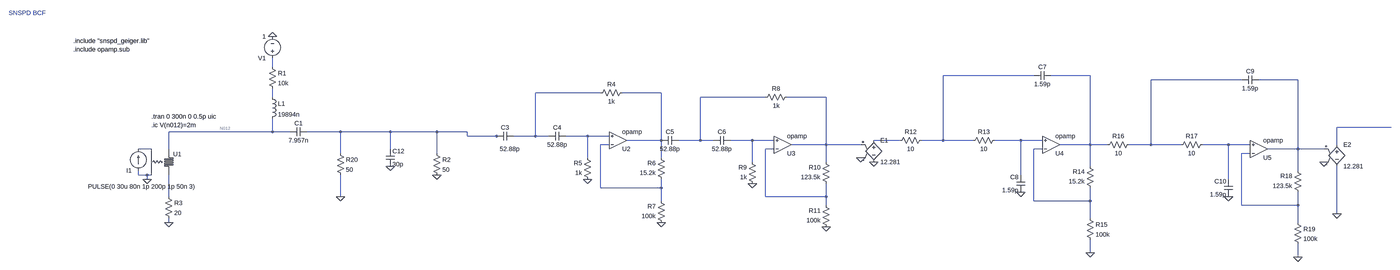
[diagram p0: schematic snspd-bcf.asc, whole sheet]
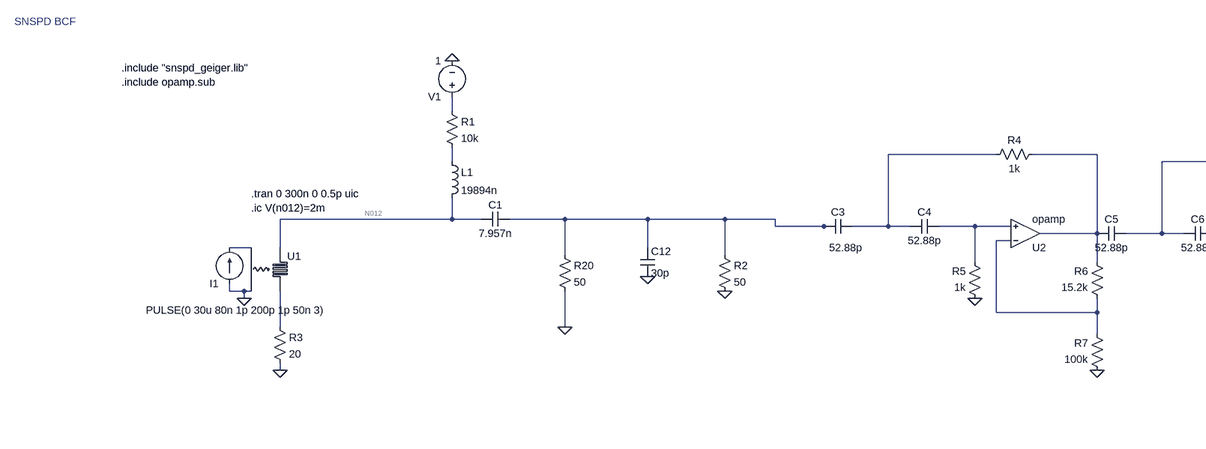
[diagram p1: schematic snspd-bcf.asc, part, row 1 of 1, column 1 of 2]
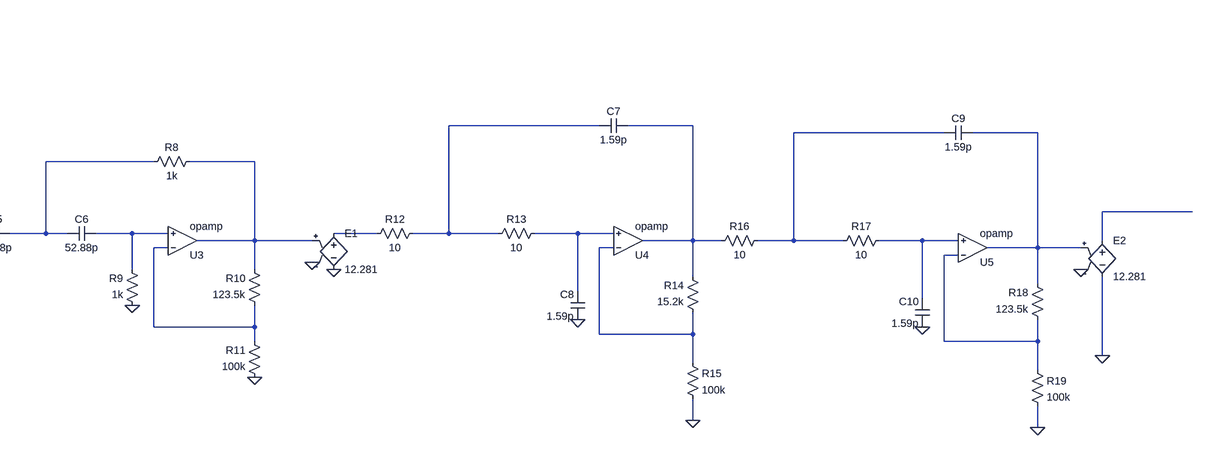
[diagram p2: schematic snspd-bcf.asc, part, row 1 of 1, column 2 of 2]
snspd-bcf.asc, the LTspice schematic file:
Version 4
SHEET 1 5868 720
WIRE 640 -768 640 -800
WIRE 3712 -736 3376 -736
WIRE 3920 -736 3776 -736
WIRE 4480 -720 4144 -720
WIRE 4688 -720 4544 -720
WIRE 2112 -672 1872 -672
WIRE 2336 -672 2192 -672
WIRE 640 -656 640 -688
WIRE 2720 -656 2480 -656
WIRE 2944 -656 2800 -656
WIRE 5056 -544 4832 -544
WIRE 640 -528 640 -576
WIRE 640 -528 224 -528
WIRE 704 -528 640 -528
WIRE 976 -528 768 -528
WIRE 1168 -528 976 -528
WIRE 1488 -528 1168 -528
WIRE 1600 -528 1488 -528
WIRE 1600 -512 1600 -528
WIRE 1728 -512 1600 -512
WIRE 1744 -512 1728 -512
WIRE 1872 -512 1872 -672
WIRE 1872 -512 1792 -512
WIRE 1920 -512 1872 -512
WIRE 2064 -512 1984 -512
WIRE 2144 -512 2064 -512
WIRE 2336 -496 2336 -672
WIRE 2336 -496 2208 -496
WIRE 2480 -496 2480 -656
WIRE 2480 -496 2400 -496
WIRE 2528 -496 2480 -496
WIRE 2672 -496 2592 -496
WIRE 2752 -496 2672 -496
WIRE 3216 -496 3120 -496
WIRE 3376 -496 3376 -736
WIRE 3376 -496 3296 -496
WIRE 3488 -496 3376 -496
WIRE 3664 -496 3568 -496
WIRE 3744 -496 3664 -496
WIRE 2144 -480 2112 -480
WIRE 2944 -480 2944 -656
WIRE 2944 -480 2816 -480
WIRE 3072 -480 2944 -480
WIRE 3920 -480 3920 -736
WIRE 3920 -480 3808 -480
WIRE 3984 -480 3920 -480
WIRE 4144 -480 4144 -720
WIRE 4144 -480 4064 -480
WIRE 4256 -480 4144 -480
WIRE 4432 -480 4336 -480
WIRE 4512 -480 4432 -480
WIRE 4832 -480 4832 -544
WIRE 160 -464 112 -464
WIRE 224 -464 224 -528
WIRE 1168 -464 1168 -528
WIRE 2752 -464 2720 -464
WIRE 3744 -464 3712 -464
WIRE 4688 -464 4688 -720
WIRE 4688 -464 4576 -464
WIRE 4784 -464 4688 -464
WIRE 976 -448 976 -528
WIRE 1488 -448 1488 -528
WIRE 4512 -448 4480 -448
WIRE 2064 -432 2064 -512
WIRE 2336 -432 2336 -496
WIRE 2672 -416 2672 -496
WIRE 2944 -416 2944 -480
WIRE 3920 -400 3920 -480
WIRE 4688 -384 4688 -464
WIRE 112 -368 112 -384
WIRE 144 -368 112 -368
WIRE 160 -368 144 -368
WIRE 3664 -368 3664 -496
WIRE 144 -352 144 -368
WIRE 4432 -352 4432 -480
WIRE 2112 -320 2112 -480
WIRE 2336 -320 2336 -352
WIRE 2336 -320 2112 -320
WIRE 224 -288 224 -368
WIRE 976 -288 976 -368
WIRE 2720 -288 2720 -464
WIRE 2944 -288 2944 -336
WIRE 2944 -288 2720 -288
WIRE 2336 -272 2336 -320
WIRE 3712 -272 3712 -464
WIRE 3920 -272 3920 -320
WIRE 3920 -272 3712 -272
WIRE 2944 -256 2944 -288
WIRE 4480 -256 4480 -448
WIRE 4688 -256 4688 -304
WIRE 4688 -256 4480 -256
WIRE 4832 -224 4832 -400
WIRE 3920 -208 3920 -272
WIRE 224 -192 224 -208
WIRE 4688 -192 4688 -256
WIRE 3920 -80 3920 -128
WIRE 4688 -64 4688 -112
FLAG 144 -352 0
FLAG 640 -880 0
FLAG 2336 -192 0
FLAG 2064 -352 0
FLAG 2944 -176 0
FLAG 2672 -336 0
FLAG 3664 -304 0
FLAG 3072 -432 0
FLAG 3120 -416 0
FLAG 3920 -80 0
FLAG 4432 -288 0
FLAG 4688 -64 0
FLAG 4832 -224 0
FLAG 4784 -416 0
FLAG 224 -192 0
FLAG 976 -288 0
FLAG 1488 -368 0
FLAG 1168 -400 0
SYMBOL snspdWithPhotonPort 224 -416 R0
WINDOW 39 -7 -9 Center 2
SYMATTR SpiceLine ""
SYMATTR InstName U1
SYMBOL current 112 -384 R180
WINDOW 3 -212 -59 Left 2
WINDOW 123 0 0 Left 2
WINDOW 39 0 0 Left 2
SYMATTR Value PULSE(0 30u 80n 1p 200p 1p 50n 3)
SYMATTR InstName I1
SYMBOL voltage 640 -784 R180
WINDOW 123 0 0 Left 2
WINDOW 39 24 -6 Left 2
SYMATTR InstName V1
SYMATTR Value 1
SYMBOL Cap 1792 -528 R90
WINDOW 0 0 32 VBottom 2
WINDOW 3 48 15 VTop 2
SYMATTR InstName C3
SYMATTR Value 52.88p
SYMBOL Cap 1984 -528 R90
WINDOW 0 0 32 VBottom 2
WINDOW 3 32 32 VTop 2
SYMATTR InstName C4
SYMATTR Value 52.88p
SYMBOL Res 2208 -688 R90
WINDOW 0 0 56 VBottom 2
WINDOW 3 32 56 VTop 2
SYMATTR InstName R4
SYMATTR Value 1k
SYMBOL Res 2080 -336 R180
WINDOW 0 36 76 Left 2
WINDOW 3 36 40 Left 2
SYMATTR InstName R5
SYMATTR Value 1k
SYMBOL Res 2352 -336 R180
WINDOW 0 36 76 Left 2
WINDOW 3 36 40 Left 2
SYMATTR InstName R6
SYMATTR Value 15.2k
SYMBOL Res 2352 -176 R180
WINDOW 0 36 76 Left 2
WINDOW 3 36 40 Left 2
SYMATTR InstName R7
SYMATTR Value 100k
SYMBOL OpAmps/opamp 2176 -432 M180
SYMATTR InstName U2
SYMATTR SpiceLine2 GBW=10000Meg
SYMBOL Cap 2400 -512 R90
WINDOW 0 0 32 VBottom 2
WINDOW 3 32 32 VTop 2
SYMATTR InstName C5
SYMATTR Value 52.88p
SYMBOL Cap 2592 -512 R90
WINDOW 0 0 32 VBottom 2
WINDOW 3 32 32 VTop 2
SYMATTR InstName C6
SYMATTR Value 52.88p
SYMBOL Res 2816 -672 R90
WINDOW 0 0 56 VBottom 2
WINDOW 3 32 56 VTop 2
SYMATTR InstName R8
SYMATTR Value 1k
SYMBOL Res 2688 -320 R180
WINDOW 0 36 76 Left 2
WINDOW 3 36 40 Left 2
SYMATTR InstName R9
SYMATTR Value 1k
SYMBOL Res 2960 -320 R180
WINDOW 0 36 76 Left 2
WINDOW 3 36 40 Left 2
SYMATTR InstName R10
SYMATTR Value 123.5k
SYMBOL Res 2960 -160 R180
WINDOW 0 36 76 Left 2
WINDOW 3 36 40 Left 2
SYMATTR InstName R11
SYMATTR Value 100k
SYMBOL OpAmps/opamp 2784 -416 M180
SYMATTR InstName U3
SYMATTR SpiceLine2 GBW=10000Meg
SYMBOL e 3120 -512 R0
SYMATTR InstName E1
SYMATTR Value 12.281
SYMBOL e 4832 -496 R0
SYMATTR InstName E2
SYMATTR Value 12.281
SYMBOL Res 3312 -512 R90
WINDOW 0 0 56 VBottom 2
WINDOW 3 32 56 VTop 2
SYMATTR InstName R12
SYMATTR Value 10
SYMBOL Res 3584 -512 R90
WINDOW 0 0 56 VBottom 2
WINDOW 3 32 56 VTop 2
SYMATTR InstName R13
SYMATTR Value 10
SYMBOL Res 3936 -304 R180
WINDOW 0 36 76 Left 2
WINDOW 3 36 40 Left 2
SYMATTR InstName R14
SYMATTR Value 15.2k
SYMBOL Res 3904 -224 R0
SYMATTR InstName R15
SYMATTR Value 100k
SYMBOL Cap 3776 -752 R90
WINDOW 0 0 32 VBottom 2
WINDOW 3 32 32 VTop 2
SYMATTR InstName C7
SYMATTR Value 1.59p
SYMBOL Cap 3680 -304 R180
WINDOW 0 24 56 Left 2
WINDOW 3 24 8 Left 2
SYMATTR InstName C8
SYMATTR Value 1.59p
SYMBOL OpAmps/opamp 3776 -416 M180
SYMATTR InstName U4
SYMATTR SpiceLine2 GBW=10000Meg
SYMBOL Res 4080 -496 R90
WINDOW 0 0 56 VBottom 2
WINDOW 3 32 56 VTop 2
SYMATTR InstName R16
SYMATTR Value 10
SYMBOL Res 4352 -496 R90
WINDOW 0 0 56 VBottom 2
WINDOW 3 32 56 VTop 2
SYMATTR InstName R17
SYMATTR Value 10
SYMBOL Res 4704 -288 R180
WINDOW 0 36 76 Left 2
WINDOW 3 36 40 Left 2
SYMATTR InstName R18
SYMATTR Value 123.5k
SYMBOL Res 4672 -208 R0
SYMATTR InstName R19
SYMATTR Value 100k
SYMBOL Cap 4544 -736 R90
WINDOW 0 0 32 VBottom 2
WINDOW 3 32 32 VTop 2
SYMATTR InstName C9
SYMATTR Value 1.59p
SYMBOL Cap 4448 -288 R180
WINDOW 0 24 56 Left 2
WINDOW 3 24 8 Left 2
SYMATTR InstName C10
SYMATTR Value 1.59p
SYMBOL OpAmps/opamp 4544 -400 M180
SYMATTR InstName U5
SYMATTR SpiceLine2 GBW=10000Meg
SYMBOL Res 624 -784 R0
SYMATTR InstName R1
SYMATTR Value 10k
SYMBOL Res 208 -304 R0
SYMATTR InstName R3
SYMATTR Value 20
SYMBOL Cap 768 -544 R90
WINDOW 0 0 32 VBottom 2
WINDOW 3 32 32 VTop 2
SYMATTR InstName C1
SYMATTR Value 7.957n
SYMATTR SpiceLine Rser=1
SYMBOL ind 624 -672 R0
SYMATTR InstName L1
SYMATTR Value 19894n
SYMATTR SpiceLine Cpar=1p
SYMBOL Res 960 -464 R0
SYMATTR InstName R20
SYMATTR Value 50
SYMBOL Res 1472 -464 R0
SYMATTR InstName R2
SYMATTR Value 50
SYMBOL Cap 1152 -464 R0
SYMATTR InstName C12
SYMATTR Value 30p
TEXT 160 -584 Left 2 !.tran 0 300n 0 0.5p uic\n.ic V(n012)=2m
TEXT -480 -968 Left 2 ;SNSPD BCF
TEXT -128 -864 Left 2 !.include "snspd_geiger.lib"\n.include opamp.sub

The netlist it stands for:
* snspd-bcf.asc
XU1 N020 0 N012 N024 nanowireBCF  ; pins gate-in photon-out source drain
I1 0 N020 PULSE(0 30u 80n 1p 200p 1p 50n 3)
V1 N001 0 1
C3 N006 N013 52.88p
C4 N014 N006 52.88p
R4 N007 N006 1k
R5 0 N014 1k
R6 N018 N007 15.2k
R7 0 N018 100k
XU2 N018 N014 N007 opamp Aol=100K GBW=10000Meg  ; pins invin noninvin out
C5 N009 N007 52.88p
C6 N015 N009 52.88p
R8 N010 N009 1k
R9 0 N015 1k
R10 N021 N010 123.5k
R11 0 N021 100k
XU3 N021 N015 N010 opamp Aol=100K GBW=10000Meg  ; pins invin noninvin out
E1 N016 0 N010 0 12.281
E2 N011 0 N005 0 12.281
R12 N002 N016 10
R13 N017 N002 10
R14 N022 N003 15.2k
R15 N022 0 100k
C7 N003 N002 1.59p
C8 0 N017 1.59p
XU4 N022 N017 N003 opamp Aol=100K GBW=10000Meg  ; pins invin noninvin out
R16 N004 N003 10
R17 N019 N004 10
R18 N023 N005 123.5k
R19 N023 0 100k
C9 N005 N004 1.59p
C10 0 N019 1.59p
XU5 N023 N019 N005 opamp Aol=100K GBW=10000Meg  ; pins invin noninvin out
R1 N001 N008 10k
R3 N024 0 20
C1 N013 N012 7.957n Rser=1
L1 N008 N012 19894n Cpar=1p
R20 N013 0 50
R2 N013 0 50
C12 N013 0 30p
.tran 0 300n 0 0.5p uic
.ic V(n012)=2m
* SNSPD BCF
.include "snspd_geiger.lib"
.include opamp.sub
.lib snspd_geiger.lib
.backanno
.end